# Altium schematic sheet radar schematic 2.SchDoc
size A4; SheetNumber: 1; SheetTotal: 1
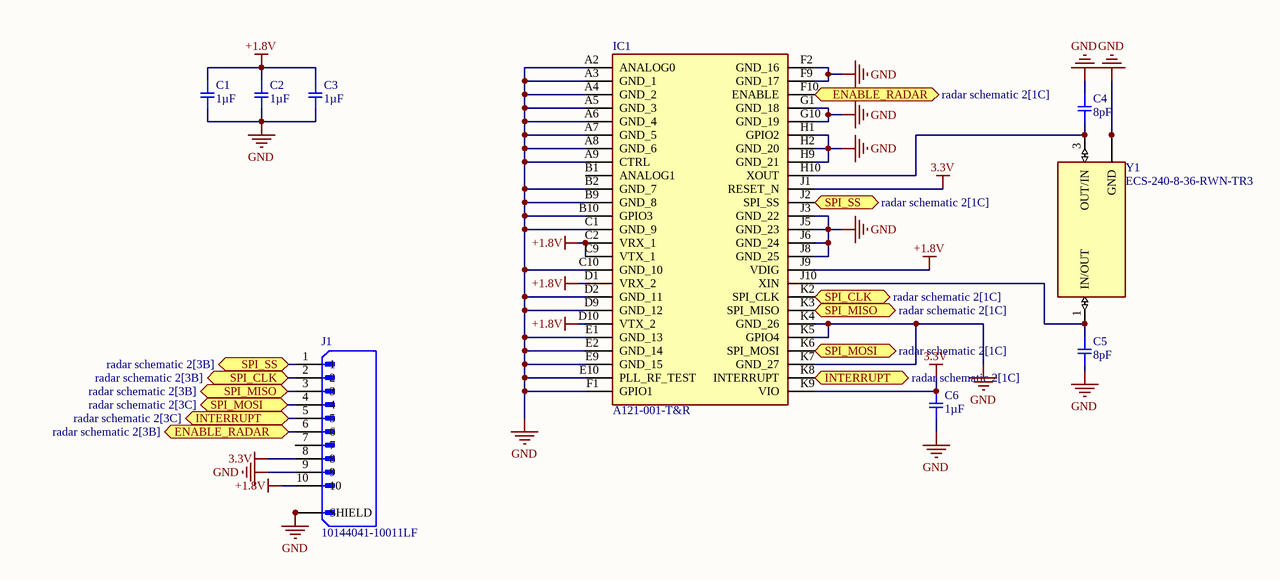
[diagram p0: radar schematic 2.SchDoc]

## Parts
C1  1µF  [SMD-0402C]
C2  1µF  [SMD-0402C]
C3  1µF  [SMD-0402C]
C4  8pF  [SMD-0402C]
C5  8pF  [SMD-0402C]
C6  1µF  [SMD-0402C]
IC1  A121-001-T&R  [A121001TR]
J1  10144041-10011LF  [AMPHENOL_10144041-10011LF]
Y1  ECS-240-8-36-RWN-TR3  [XTAL_ECS-240-8-36-RWN-TR3]

## Ports
ENABLE_RADAR (bidir, see radar schematic 2[1C]), ENABLE_RADAR (bidir, see radar schematic 2[3B]), INTERRUPT (bidir, see radar schematic 2[1C]), INTERRUPT (bidir, see radar schematic 2[3C]), SPI_CLK (bidir, see radar schematic 2[1C]), SPI_CLK (bidir, see radar schematic 2[3B]), SPI_MISO (bidir, see radar schematic 2[1C]), SPI_MISO (bidir, see radar schematic 2[3B]), SPI_MOSI (bidir, see radar schematic 2[1C]), SPI_MOSI (bidir, see radar schematic 2[3C]), SPI_SS (bidir, see radar schematic 2[1C]), SPI_SS (bidir, see radar schematic 2[3B])

## Nets
3.3V: C6.1 IC1.J1(RESET_N) IC1.K9(VIO) J1.8
+1.8V: C1.1 C2.1 C3.1 IC1.C2(VRX_1) IC1.C9(VTX_1) IC1.D1(VRX_2) IC1.D10(VTX_2) IC1.J9(VDIG) J1.10
GND: C1.2 C2.2 C3.2 C4.1 C5.2 C6.2 IC1.A2(ANALOG0) IC1.A3(GND_1) IC1.A4(GND_2) IC1.A5(GND_3) IC1.A6(GND_4) IC1.A7(GND_5) IC1.A8(GND_6) IC1.A9(CTRL) IC1.B2(GND_7) IC1.B9(GND_8) IC1.B10(GPIO3) IC1.C1(GND_9) IC1.C10(GND_10) IC1.D2(GND_11) IC1.D9(GND_12) IC1.E1(GND_13) IC1.E2(GND_14) IC1.E9(GND_15) IC1.E10(PLL_RF_TEST) IC1.F1(GPIO1) IC1.F2(GND_16) IC1.F9(GND_17) IC1.G1(GND_18) IC1.G10(GND_19) IC1.H1(GPIO2) IC1.H2(GND_20) IC1.H9(GND_21) IC1.J3(GND_22) IC1.J5(GND_23) IC1.J6(GND_24) IC1.J8(GND_25) IC1.K4(GND_26) IC1.K5(GPIO4) IC1.K7(GND_27) J1.9 J1.S1(SHIELD) J1.S2(SHIELD) Y1.2(GND) Y1.4(GND)
ENABLE_RADAR: IC1.F10(ENABLE) J1.6 ; port ENABLE_RADAR
INTERRUPT: IC1.K8(INTERRUPT) J1.5 ; port INTERRUPT
SPI_CLK: IC1.K2(SPI_CLK) J1.2 ; port SPI_CLK
SPI_MISO: IC1.K3(SPI_MISO) J1.3 ; port SPI_MISO
SPI_MOSI: IC1.K6(SPI_MOSI) J1.4 ; port SPI_MOSI
SPI_SS: IC1.J2(SPI_SS) J1.1 ; port SPI_SS
NetC4_2: C4.2 IC1.H10(XOUT) Y1.3(OUT/IN)
NetC5_1: C5.1 IC1.J10(XIN) Y1.1(IN/OUT)

Not connected (* = marked no-connect by the designer): IC1 B1(ANALOG1); J1 7

## Notes on the sheet
- Title:
- Project:
- Date:
- Time:
- Sheet
- Size:
- A4
- Of
- Designed By:
- File:
- Shourav.EEE015@gmail.com
- Shourav Sarkar
- Rev:

## Library data of the parts
C1-C3 C6 = GCM155C71A105KE38D: CAP CER 1UF 10V X7S 0402; Manufacturer: Murata Electronics North America; Factory Stock: 0; Unit Price (USD): 0.12; Minimum Quantity: 1; Tolerance: ±10%; Datasheets: http://www.murata.com/~/media/webrenewal/support/library/catalog/products/capacitor/mlcc/c03e.ashx; Image: //media.digikey.com/Renders/Murata%20Renders/ZRB-SERIES-0402.jpg; Digi-Key Part Number: 490-13409-1-ND; Part Number: GCM155C71A105KE38D; Quantity Available: 7240; @ qty: 0; Packaging: Cut Tape (CT); Series: GCM; Part Status: Active; Value: 1µF; Voltage: 10V; Temperature Coefficient: X7S; Operating Temperature: -55°C ~ 125°C; Features: -; Ratings: AEC-Q200; Applications: Automotive; Mounting Type: Surface Mount, MLCC; Package / Case: 0402 (1005 Metric); Size / Dimension: 0.039" L x 0.020" W (1.00mm x 0.50mm); Height - Seated (Max): -; Thickness (Max): 0.022" (0.55mm); Lead Spacing: -; Lead Style: -
C4 C5 = GRM1555C1H8R0BA01D: CAP CER 8PF 50V NP0 0402; Manufacturer: Murata Electronics North America; Factory Stock: 0; Unit Price (USD): 0.1; Minimum Quantity: 1; Tolerance: ±0.1pF; Temperature Coefficient: C0G, NP0; Datasheets: http://www.murata.com/~/media/webrenewal/support/library/catalog/products/capacitor/mlcc/c02e.pdf; Image: //media.digikey.com/Renders/Murata%20Renders/ZRB-SERIES-0402.jpg; Digi-Key Part Number: 490-8230-1-ND; Part Number: GRM1555C1H8R0BA01D; Quantity Available: 3665; @ qty: 0; Packaging: Cut Tape (CT); Series: GRM; Part Status: Active; Value: 8pF; Voltage: 50V; Operating Temperature: -55°C ~ 125°C; Features: -; Ratings: -; Applications: General Purpose; Mounting Type: Surface Mount, MLCC; Package / Case: 0402 (1005 Metric); Size / Dimension: 0.039" L x 0.020" W (1.00mm x 0.50mm); Height - Seated (Max): -; Thickness (Max): 0.022" (0.55mm); Lead Spacing: -; Lead Style: -
IC1 = A121-001-T&R: Integrated Circuit; Manufacturer_Name: Acconeer AB; Datasheet Link: https://gr.mouser.com/datasheet/2/1126/A121_datasheet-3133196.pdf; Height: 0.899mm; Manufacturer_Part_Number: A121-001-T&R; Mouser Part Number: 925-A121-001-T&R; Mouser Price/Stock: https://www.mouser.co.uk/ProductDetail/Acconeer/A121-001-TR?qs=amGC7iS6iy%2F9krRiPHmNkQ%3D%3D
J1 = 10144041-10011LF: MF: {'manufacturer': u'Amphenol ICC (FCI)'}; Package: None; Price: None; Value: *; MP: 10144041-10011LF; Availability: Unavailable
Y1 = ECS-240-8-36-RWN-TR3: MF: {'manufacturer': u'ECS Inc.'}; Package: None; Price: None; Value: *; MP: ECS-240-8-36-RWN-TR3; Availability: Unavailable